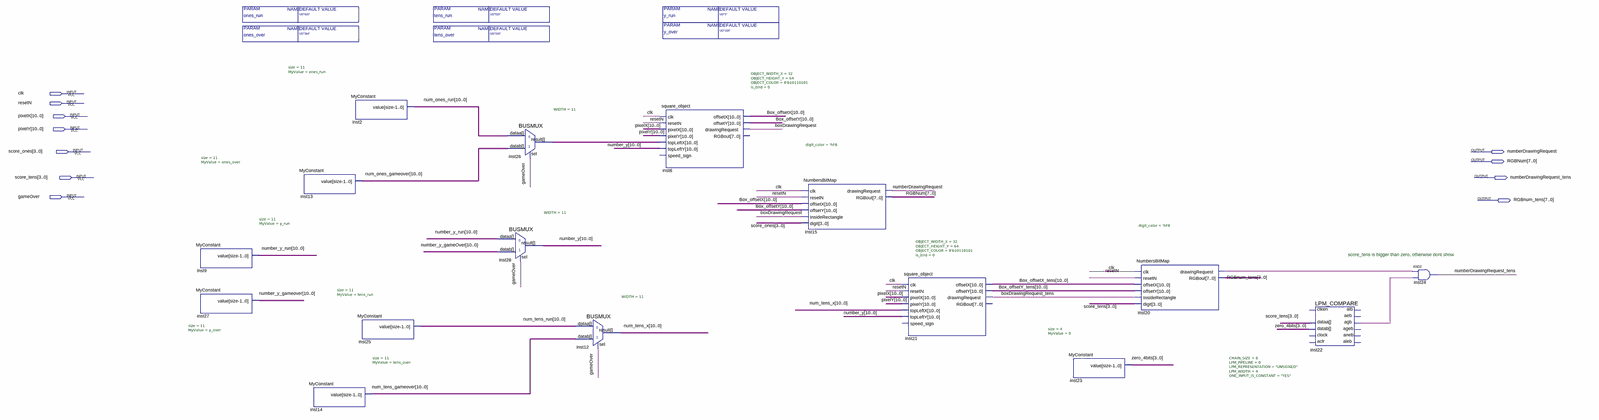
[diagram p0: schematic sheet, whole]
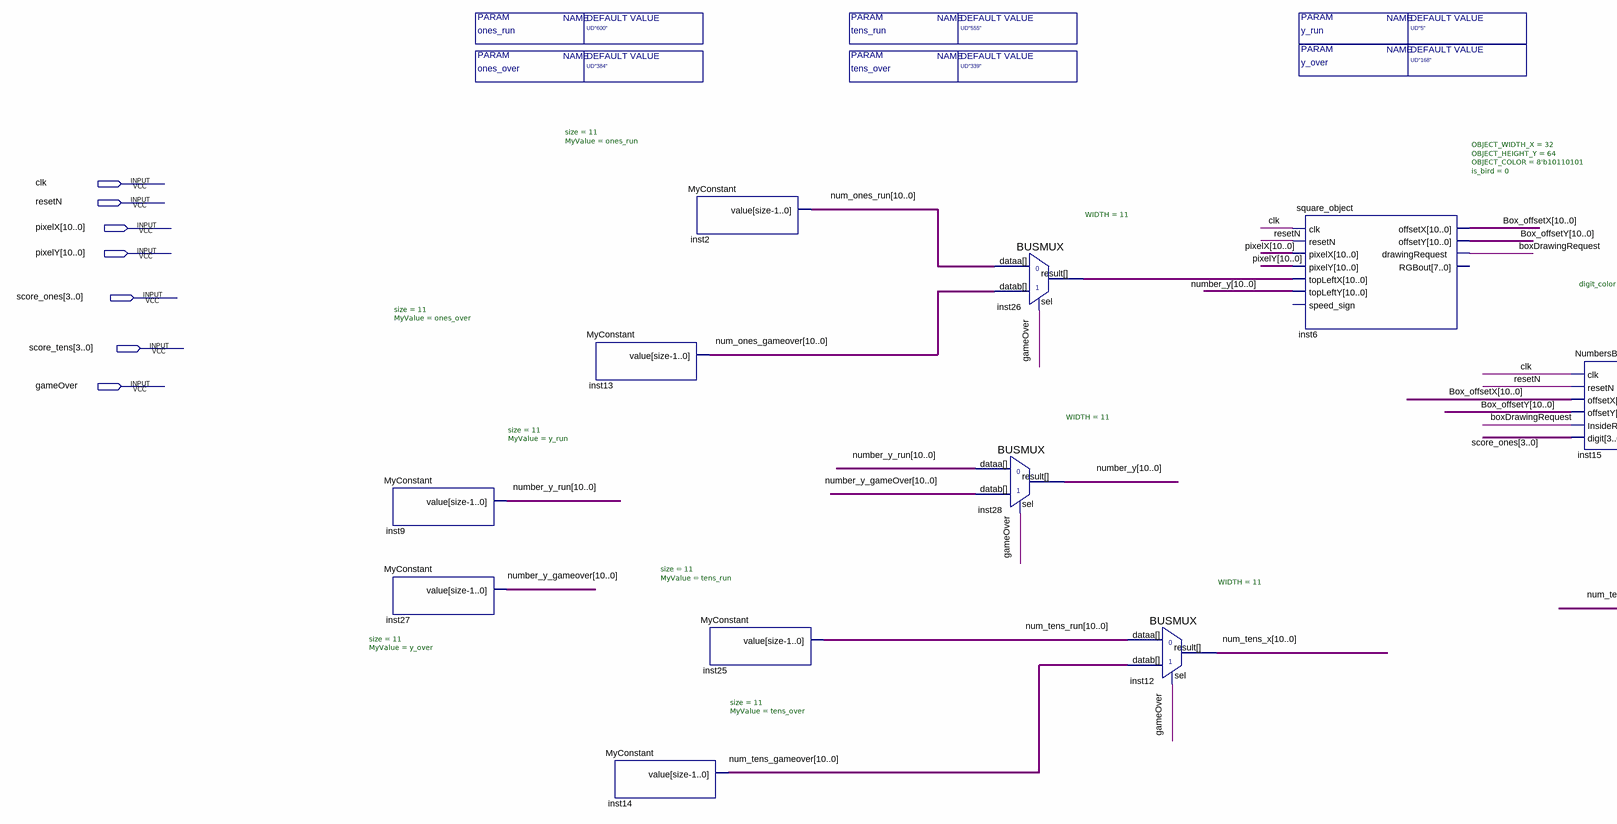
[diagram p1: schematic sheet, left part]
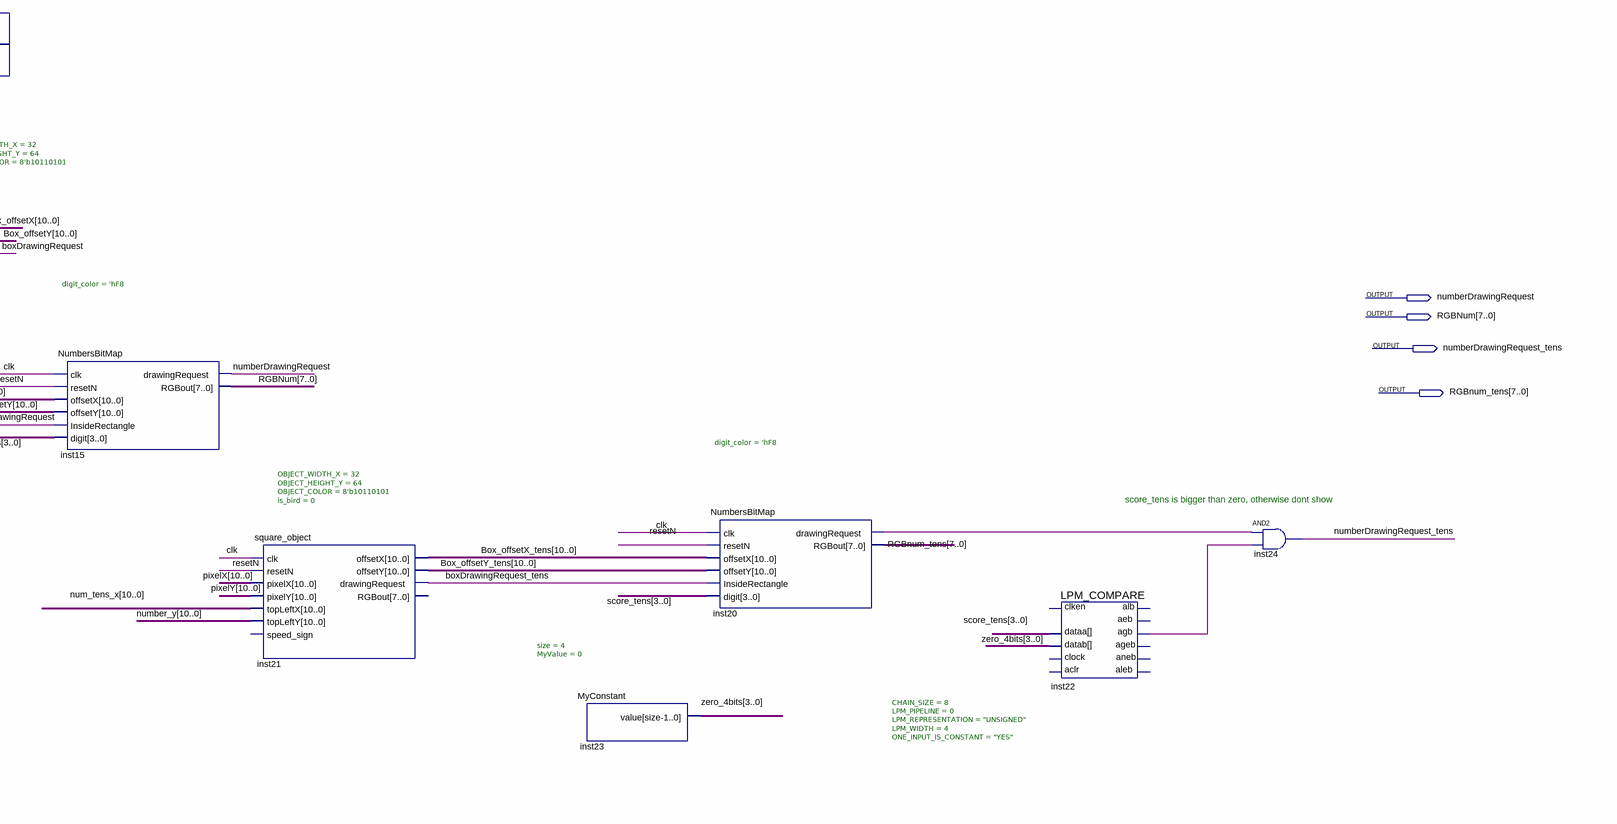
[diagram p2: schematic sheet, right part]
// Quartus schematic score_block_T.bdf as structural Verilog: 16 symbols, 11 pins
module score_block_T #(parameter ones_over = "UD\"384\"", parameter ones_run = "UD\"600\"", parameter tens_run = "UD\"555\"", parameter tens_over = "UD\"339\"", parameter y_run = "UD\"5\"", parameter y_over = "UD\"168\"") (
  input  clk,
  input  resetN,
  input  [10:0] pixelX,
  input  [10:0] pixelY,
  input  [3:0] score_ones,
  input  [3:0] score_tens,
  input  gameOver,
  output numberDrawingRequest,
  output [7:0] RGBNum,
  output numberDrawingRequest_tens,
  output [7:0] RGBnum_tens
);

  wire boxDrawingRequest, boxDrawingRequest_tens, inst20_drawingrequest, inst22_agb;
  wire [3:0] zero_4bits;
  wire [10:0] Box_offsetX, Box_offsetX_tens, Box_offsetY, Box_offsetY_tens, inst26_result, num_ones_gameover,
       num_ones_run, num_tens_gameover, num_tens_run, num_tens_x, number_y, number_y_gameover, number_y_run;

  MyConstant #(.size(11), .MyValue(y_run)) inst9 (.value(number_y_run));
  MyConstant #(.size(11), .MyValue(y_over)) inst27 (.value(number_y_gameover));
  MyConstant #(.size(11), .MyValue(ones_over)) inst13 (.value(num_ones_gameover));
  MyConstant #(.size(11), .MyValue(tens_over)) inst14 (.value(num_tens_gameover));
  MyConstant #(.size(11), .MyValue(ones_run)) inst2 (.value(num_ones_run));
  MyConstant #(.size(11), .MyValue(tens_run)) inst25 (.value(num_tens_run));
  BUSMUX #(.WIDTH(11)) inst28 (.datab(number_y_gameover), .sel(gameOver), .dataa(number_y_run), .result(number_y));
  BUSMUX #(.WIDTH(11)) inst26 (.datab(num_ones_gameover), .sel(gameOver), .dataa(num_ones_run), .result(inst26_result));
  BUSMUX #(.WIDTH(11)) inst12 (.datab(num_tens_gameover), .sel(gameOver), .dataa(num_tens_run), .result(num_tens_x));
  square_object #(.OBJECT_WIDTH_X(32), .OBJECT_HEIGHT_Y(64), .OBJECT_COLOR(8'b10110101), .is_bird(0)) inst6 (
    .clk(clk), .resetN(resetN), .pixelX(pixelX), .pixelY(pixelY), .topLeftX(inst26_result),
    .topLeftY(number_y), .offsetX(Box_offsetX), .offsetY(Box_offsetY), .drawingRequest(boxDrawingRequest));  // open: speed_sign, RGBout
  NumbersBitMap #(.digit_color('hF8)) inst15 (
    .clk(clk), .resetN(resetN), .offsetX(Box_offsetX), .offsetY(Box_offsetY),
    .InsideRectangle(boxDrawingRequest), .digit(score_ones), .drawingRequest(numberDrawingRequest),
    .RGBout(RGBNum));
  square_object #(.OBJECT_WIDTH_X(32), .OBJECT_HEIGHT_Y(64), .OBJECT_COLOR(8'b10110101), .is_bird(0)) inst21 (
    .clk(clk), .resetN(resetN), .pixelX(pixelX), .pixelY(pixelY), .topLeftX(num_tens_x), .topLeftY(number_y),
    .offsetX(Box_offsetX_tens), .offsetY(Box_offsetY_tens), .drawingRequest(boxDrawingRequest_tens));  // open: speed_sign, RGBout
  MyConstant #(.size(4), .MyValue(0)) inst23 (.value(zero_4bits));
  NumbersBitMap #(.digit_color('hF8)) inst20 (
    .clk(clk), .resetN(resetN), .offsetX(Box_offsetX_tens), .offsetY(Box_offsetY_tens),
    .InsideRectangle(boxDrawingRequest_tens), .digit(score_tens), .drawingRequest(inst20_drawingrequest),
    .RGBout(RGBnum_tens));
  LPM_COMPARE #(.CHAIN_SIZE(8), .LPM_PIPELINE(0), .LPM_REPRESENTATION("UNSIGNED"), .LPM_WIDTH(4), .ONE_INPUT_IS_CONSTANT("YES")) inst22 (
    .dataa(score_tens), .datab(zero_4bits), .agb(inst22_agb));  // open: clock, aclr, clken, aleb, aeb, aneb, ageb, alb
  and inst24 (numberDrawingRequest_tens, inst20_drawingrequest, inst22_agb);

  // Notes on the sheet:
  //   score_tens is bigger than zero, otherwise dont show
endmodule
